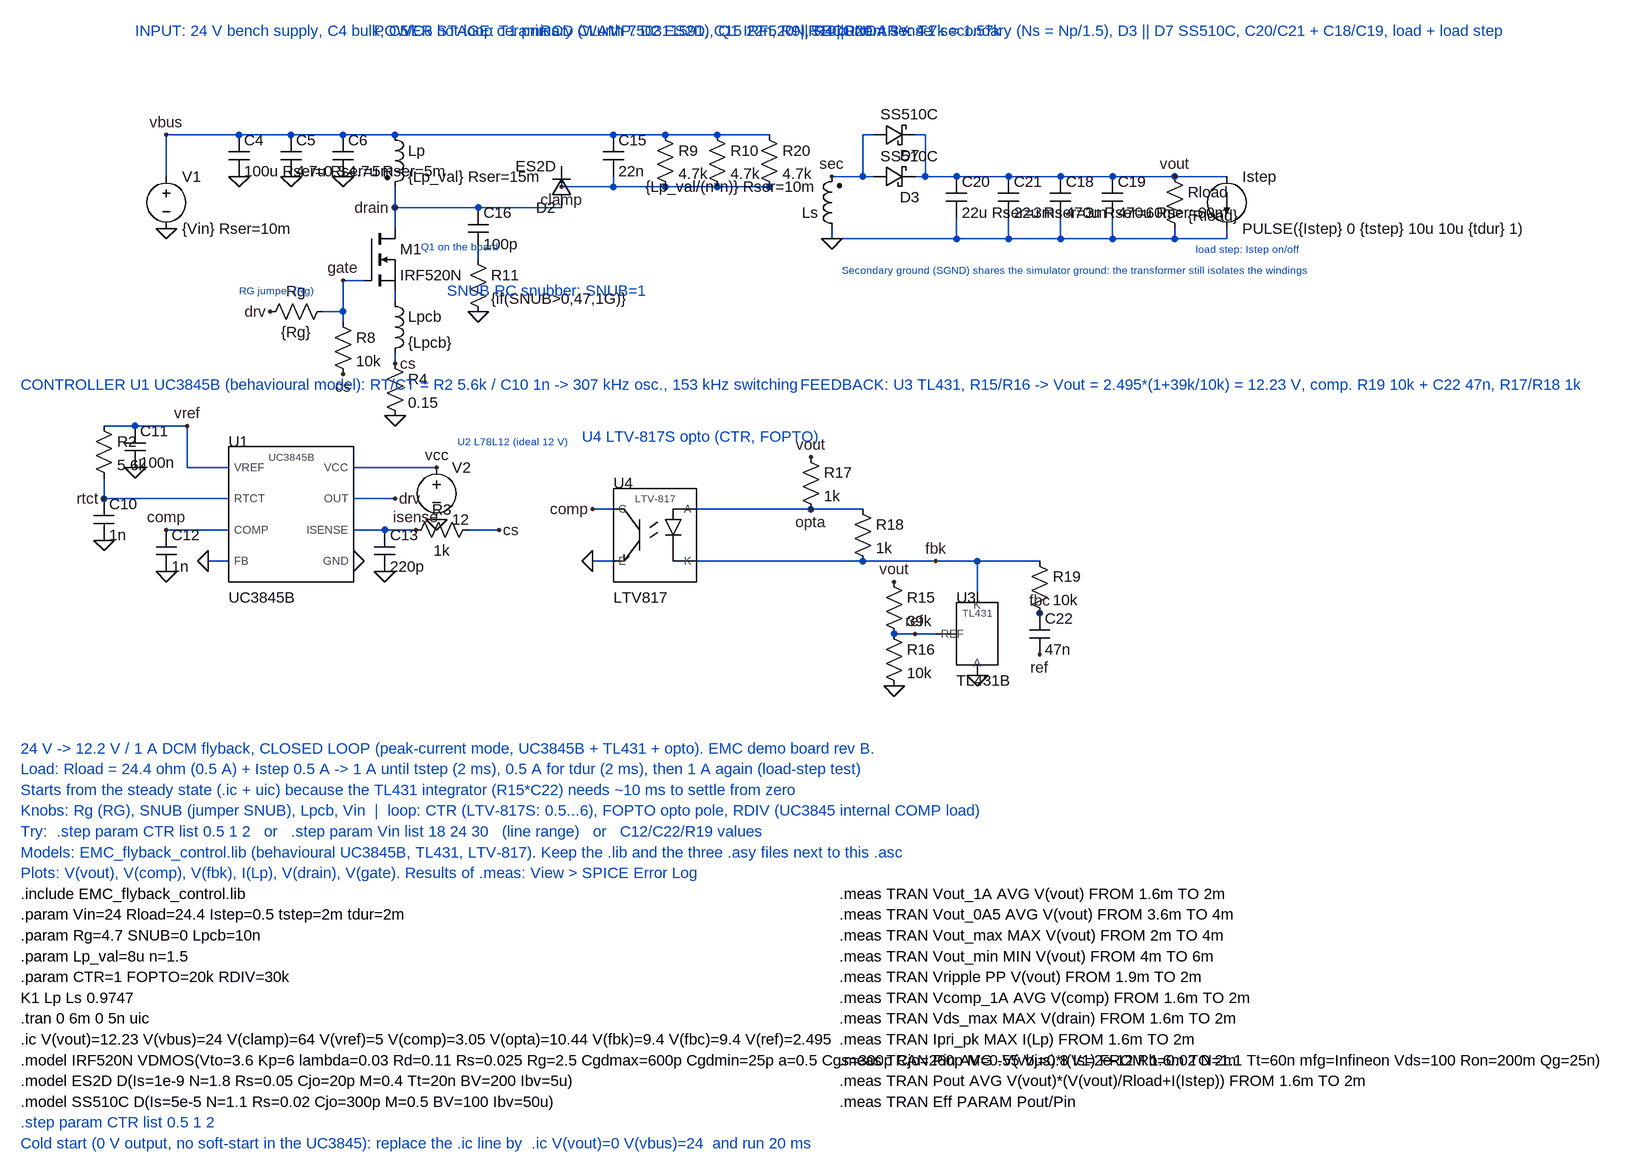
[diagram p0: schematic EMC_flyback_closed_loop.asc]
EMC_flyback_closed_loop.asc, the LTspice schematic file:
Version 4
SHEET 1 2000 1500
WIRE 64 192 64 128
WIRE 64 128 176 128
WIRE 176 128 256 128
WIRE 256 128 336 128
WIRE 336 128 416 128
WIRE 416 128 752 128
WIRE 752 128 832 128
WIRE 832 128 912 128
WIRE 912 128 992 128
WIRE 416 208 416 240
WIRE 416 240 416 272
WIRE 416 368 416 384
WIRE 416 464 416 480
WIRE 304 400 336 400
WIRE 336 400 336 352
WIRE 336 352 368 352
WIRE 336 400 336 416
WIRE 416 240 544 240
WIRE 544 304 544 320
WIRE 544 240 672 240
WIRE 672 176 672 208
WIRE 672 208 752 208
WIRE 752 208 832 208
WIRE 832 208 912 208
WIRE 912 208 992 208
WIRE 752 192 752 208
WIRE 832 208 832 208
WIRE 912 208 912 208
WIRE 992 208 992 208
WIRE 1088 192 1136 192
WIRE 1136 192 1152 192
WIRE 1216 192 1232 192
WIRE 1232 192 1280 192
WIRE 1280 192 1360 192
WIRE 1360 192 1440 192
WIRE 1440 192 1520 192
WIRE 1520 192 1616 192
WIRE 1616 192 1696 192
WIRE 1136 192 1136 128
WIRE 1136 128 1152 128
WIRE 1216 128 1232 128
WIRE 1232 128 1232 192
WIRE 1280 256 1280 288
WIRE 1360 256 1360 288
WIRE 1440 256 1440 288
WIRE 1520 256 1520 288
WIRE 1616 272 1616 288
WIRE 1088 272 1088 288
WIRE 1088 288 1280 288
WIRE 1280 288 1360 288
WIRE 1360 288 1440 288
WIRE 1440 288 1520 288
WIRE 1520 288 1616 288
WIRE 1616 288 1696 288
WIRE 1696 272 1696 288
WIRE 160 640 96 640
WIRE 96 640 96 576
WIRE 96 576 16 576
WIRE 16 576 -32 576
WIRE -32 656 -32 688
WIRE 160 688 -32 688
WIRE 160 736 64 736
WIRE 160 784 128 784
WIRE 352 688 416 688
WIRE 352 640 480 640
WIRE 352 736 400 736
WIRE 400 736 448 736
WIRE 528 736 576 736
WIRE 752 704 720 704
WIRE 752 784 720 784
WIRE 880 704 1056 704
WIRE 1056 704 1136 704
WIRE 880 784 1136 784
WIRE 1136 784 1248 784
WIRE 1248 784 1312 784
WIRE 1312 784 1408 784
WIRE 1312 784 1312 832
WIRE 1184 896 1216 896
WIRE 1216 896 1248 896
WIRE 1408 864 1408 864
FLAG 64 272 0
FLAG 176 192 0
FLAG 256 192 0
FLAG 336 192 0
FLAG 64 128 vbus
FLAG 416 240 drain
FLAG 416 560 0
FLAG 416 480 cs
FLAG 224 400 drv
FLAG 336 496 cs
FLAG 336 352 gate
FLAG 544 400 0
FLAG 672 208 clamp
FLAG 1088 192 sec
FLAG 1616 192 vout
FLAG 1088 288 0
FLAG 16 640 0
FLAG -32 752 0
FLAG 96 576 vref
FLAG -32 688 rtct
FLAG 64 800 0
FLAG 64 736 comp
FLAG 128 784 0
FLAG 416 688 drv
FLAG 480 720 0
FLAG 480 640 vcc
FLAG 352 784 0
FLAG 576 736 cs
FLAG 400 800 0
FLAG 448 736 isense
FLAG 720 704 comp
FLAG 720 784 0
FLAG 1056 624 vout
FLAG 1056 704 opta
FLAG 1248 784 fbk
FLAG 1312 960 0
FLAG 1184 816 vout
FLAG 1184 976 0
FLAG 1216 896 ref
FLAG 1408 928 ref
FLAG 1408 864 fbc
SYMBOL voltage 64 176 R0
SYMATTR InstName V1
SYMATTR Value {Vin} Rser=10m
SYMBOL cap 160 128 R0
SYMATTR InstName C4
SYMATTR Value 100u Rser=0.3
SYMBOL cap 240 128 R0
SYMATTR InstName C5
SYMATTR Value 4.7u Rser=5m
SYMBOL cap 320 128 R0
SYMATTR InstName C6
SYMATTR Value 4.7u Rser=5m
SYMBOL ind2 400 112 R0
SYMATTR InstName Lp
SYMATTR Value {Lp_val} Rser=15m
SYMBOL nmos 368 272 R0
SYMATTR InstName M1
SYMATTR Value IRF520N
SYMBOL ind 400 368 R0
SYMATTR InstName Lpcb
SYMATTR Value {Lpcb}
SYMBOL res 400 464 R0
SYMATTR InstName R4
SYMATTR Value 0.15
SYMBOL res 320 384 R90
WINDOW 0 0 56 VBottom 2
WINDOW 3 32 56 VTop 2
SYMATTR InstName Rg
SYMATTR Value {Rg}
SYMBOL res 320 400 R0
SYMATTR InstName R8
SYMATTR Value 10k
SYMBOL cap 528 240 R0
SYMATTR InstName C16
SYMATTR Value 100p
SYMBOL res 528 304 R0
SYMATTR InstName R11
SYMATTR Value {if(SNUB>0,47,1G)}
SYMBOL diode 688 240 R180
SYMATTR InstName D2
SYMATTR Value ES2D
SYMBOL cap 736 128 R0
SYMATTR InstName C15
SYMATTR Value 22n
SYMBOL res 816 112 R0
SYMATTR InstName R9
SYMATTR Value 4.7k
SYMBOL res 896 112 R0
SYMATTR InstName R10
SYMATTR Value 4.7k
SYMBOL res 976 112 R0
SYMATTR InstName R20
SYMATTR Value 4.7k
SYMBOL ind2 1104 288 R180
SYMATTR InstName Ls
SYMATTR Value {Lp_val/(n*n)} Rser=10m
SYMBOL schottky 1152 208 R270
WINDOW 0 0 56 VBottom 2
WINDOW 3 32 56 VTop 2
SYMATTR InstName D3
SYMATTR Value SS510C
SYMBOL schottky 1152 144 R270
WINDOW 0 0 56 VBottom 2
WINDOW 3 32 56 VTop 2
SYMATTR InstName D7
SYMATTR Value SS510C
SYMBOL cap 1264 192 R0
SYMATTR InstName C20
SYMATTR Value 22u Rser=3m
SYMBOL cap 1344 192 R0
SYMATTR InstName C21
SYMATTR Value 22u Rser=3m
SYMBOL cap 1424 192 R0
SYMATTR InstName C18
SYMATTR Value 470u Rser=60m
SYMBOL cap 1504 192 R0
SYMATTR InstName C19
SYMATTR Value 470u Rser=60m
SYMBOL res 1600 176 R0
SYMATTR InstName Rload
SYMATTR Value {Rload}
SYMBOL current 1696 192 R0
SYMATTR InstName Istep
SYMATTR Value PULSE({Istep} 0 {tstep} 10u 10u {tdur} 1)
SYMBOL UC3845B_beh 256 704 R0
SYMATTR InstName U1
SYMATTR Value UC3845B
SYMBOL cap 0 576 R0
SYMATTR InstName C11
SYMATTR Value 100n
SYMBOL res -48 560 R0
SYMATTR InstName R2
SYMATTR Value 5.6k
SYMBOL cap -48 688 R0
SYMATTR InstName C10
SYMATTR Value 1n
SYMBOL cap 48 736 R0
SYMATTR InstName C12
SYMATTR Value 1n
SYMBOL voltage 480 624 R0
SYMATTR InstName V2
SYMATTR Value 12
SYMBOL res 544 720 R90
WINDOW 0 0 56 VBottom 2
WINDOW 3 32 56 VTop 2
SYMATTR InstName R3
SYMATTR Value 1k
SYMBOL cap 384 736 R0
SYMATTR InstName C13
SYMATTR Value 220p
SYMBOL LTV817_beh 816 736 R0
SYMATTR InstName U4
SYMATTR Value LTV817
SYMBOL res 1040 608 R0
SYMATTR InstName R17
SYMATTR Value 1k
SYMBOL res 1120 688 R0
SYMATTR InstName R18
SYMATTR Value 1k
SYMBOL TL431_beh 1312 896 R0
SYMATTR InstName U3
SYMATTR Value TL431B
SYMBOL res 1168 800 R0
SYMATTR InstName R15
SYMATTR Value 39k
SYMBOL res 1168 880 R0
SYMATTR InstName R16
SYMATTR Value 10k
SYMBOL res 1392 768 R0
SYMATTR InstName R19
SYMATTR Value 10k
SYMBOL cap 1392 864 R0
SYMATTR InstName C22
SYMATTR Value 47n
TEXT 16 -32 Left 2 ;INPUT: 24 V bench supply, C4 bulk, C5/C6 hot-loop ceramics
TEXT 384 -32 Left 2 ;POWER STAGE: T1 primary (Wurth 750311591), Q1 IRF520N, R4 current sense
TEXT 456 300 Left 1 ;Q1 on the board
TEXT 176 368 Left 1 ;RG jumper (Rg)
TEXT 496 368 Left 2 ;SNUB RC snubber: SNUB=1
TEXT 640 -32 Left 2 ;RCD CLAMP: D2 ES2D, C15 22n, R9||R10||R20 = 3 x 4.7k = 1.57k
TEXT 1056 -32 Left 2 ;SECONDARY: T1 secondary (Ns = Np/1.5), D3 || D7 SS510C, C20/C21 + C18/C19, load + load step
TEXT 1104 336 Left 1 ;Secondary ground (SGND) shares the simulator ground: the transformer still isolates the windings
TEXT 1648 304 Left 1 ;load step: Istep on/off
TEXT -160 512 Left 2 ;CONTROLLER U1 UC3845B (behavioural model): RT/CT = R2 5.6k / C10 1n -> 307 kHz osc., 153 kHz switching
TEXT 512 600 Left 1 ;U2 L78L12 (ideal 12 V)
TEXT 704 592 Left 2 ;U4 LTV-817S opto (CTR, FOPTO)
TEXT 1040 512 Left 2 ;FEEDBACK: U3 TL431, R15/R16 -> Vout = 2.495*(1+39k/10k) = 12.23 V, comp. R19 10k + C22 47n, R17/R18 1k
TEXT -160 1072 Left 2 ;24 V -> 12.2 V / 1 A DCM flyback, CLOSED LOOP (peak-current mode, UC3845B + TL431 + opto). EMC demo board rev B.
TEXT -160 1104 Left 2 ;Load: Rload = 24.4 ohm (0.5 A) + Istep 0.5 A -> 1 A until tstep (2 ms), 0.5 A for tdur (2 ms), then 1 A again (load-step test)
TEXT -160 1136 Left 2 ;Starts from the steady state (.ic + uic) because the TL431 integrator (R15*C22) needs ~10 ms to settle from zero
TEXT -160 1168 Left 2 ;Knobs: Rg (RG), SNUB (jumper SNUB), Lpcb, Vin  |  loop: CTR (LTV-817S: 0.5...6), FOPTO opto pole, RDIV (UC3845 internal COMP load)
TEXT -160 1200 Left 2 ;Try:  .step param CTR list 0.5 1 2   or   .step param Vin list 18 24 30   (line range)   or   C12/C22/R19 values
TEXT -160 1232 Left 2 ;Models: EMC_flyback_control.lib (behavioural UC3845B, TL431, LTV-817). Keep the .lib and the three .asy files next to this .asc
TEXT -160 1264 Left 2 ;Plots: V(vout), V(comp), V(fbk), I(Lp), V(drain), V(gate). Results of .meas: View > SPICE Error Log
TEXT -160 1296 Left 2 !.include EMC_flyback_control.lib
TEXT -160 1328 Left 2 !.param Vin=24 Rload=24.4 Istep=0.5 tstep=2m tdur=2m
TEXT -160 1360 Left 2 !.param Rg=4.7 SNUB=0 Lpcb=10n
TEXT -160 1392 Left 2 !.param Lp_val=8u n=1.5
TEXT -160 1424 Left 2 !.param CTR=1 FOPTO=20k RDIV=30k
TEXT -160 1456 Left 2 !K1 Lp Ls 0.9747
TEXT -160 1488 Left 2 !.tran 0 6m 0 5n uic
TEXT -160 1520 Left 2 !.ic V(vout)=12.23 V(vbus)=24 V(clamp)=64 V(vref)=5 V(comp)=3.05 V(opta)=10.44 V(fbk)=9.4 V(fbc)=9.4 V(ref)=2.495
TEXT -160 1552 Left 2 !.model IRF520N VDMOS(Vto=3.6 Kp=6 lambda=0.03 Rd=0.11 Rs=0.025 Rg=2.5 Cgdmax=600p Cgdmin=25p a=0.5 Cgs=300p Cjo=260p M=0.55 Vj=0.8 Is=2e-12 Rb=0.02 N=1.1 Tt=60n mfg=Infineon Vds=100 Ron=200m Qg=25n)
TEXT -160 1584 Left 2 !.model ES2D D(Is=1e-9 N=1.8 Rs=0.05 Cjo=20p M=0.4 Tt=20n BV=200 Ibv=5u)
TEXT -160 1616 Left 2 !.model SS510C D(Is=5e-5 N=1.1 Rs=0.02 Cjo=300p M=0.5 BV=100 Ibv=50u)
TEXT -160 1648 Left 2 ;.step param CTR list 0.5 1 2
TEXT -160 1680 Left 2 ;Cold start (0 V output, no soft-start in the UC3845): replace the .ic line by  .ic V(vout)=0 V(vbus)=24  and run 20 ms
TEXT 1100 1296 Left 2 !.meas TRAN Vout_1A AVG V(vout) FROM 1.6m TO 2m
TEXT 1100 1328 Left 2 !.meas TRAN Vout_0A5 AVG V(vout) FROM 3.6m TO 4m
TEXT 1100 1360 Left 2 !.meas TRAN Vout_max MAX V(vout) FROM 2m TO 4m
TEXT 1100 1392 Left 2 !.meas TRAN Vout_min MIN V(vout) FROM 4m TO 6m
TEXT 1100 1424 Left 2 !.meas TRAN Vripple PP V(vout) FROM 1.9m TO 2m
TEXT 1100 1456 Left 2 !.meas TRAN Vcomp_1A AVG V(comp) FROM 1.6m TO 2m
TEXT 1100 1488 Left 2 !.meas TRAN Vds_max MAX V(drain) FROM 1.6m TO 2m
TEXT 1100 1520 Left 2 !.meas TRAN Ipri_pk MAX I(Lp) FROM 1.6m TO 2m
TEXT 1100 1552 Left 2 !.meas TRAN Pin AVG -V(vbus)*I(V1) FROM 1.6m TO 2m
TEXT 1100 1584 Left 2 !.meas TRAN Pout AVG V(vout)*(V(vout)/Rload+I(Istep)) FROM 1.6m TO 2m
TEXT 1100 1616 Left 2 !.meas TRAN Eff PARAM Pout/Pin

The netlist it stands for:
* EMC_flyback_closed_loop.asc
V1 vbus 0 {Vin} Rser=10m
C4 vbus 0 100u Rser=0.3
C5 vbus 0 4.7u Rser=5m
C6 vbus 0 4.7u Rser=5m
Lp vbus drain {Lp_val} Rser=15m
M1 drain gate N001 N001 IRF520N
Lpcb N001 cs {Lpcb}
R4 cs 0 0.15
Rg gate drv {Rg}
R8 gate cs 10k
C16 drain N002 100p
R11 N002 0 {if(SNUB>0,47,1G)}
D2 drain clamp ES2D
C15 vbus clamp 22n
R9 vbus clamp 4.7k
R10 vbus clamp 4.7k
R20 vbus clamp 4.7k
Ls 0 sec {Lp_val/(n*n)} Rser=10m
D3 sec vout SS510C
D7 sec vout SS510C
C20 vout 0 22u Rser=3m
C21 vout 0 22u Rser=3m
C18 vout 0 470u Rser=60m
C19 vout 0 470u Rser=60m
Rload vout 0 {Rload}
Istep vout 0 PULSE({Istep} 0 {tstep} 10u 10u {tdur} 1)
XU1 comp 0 isense rtct 0 drv vcc vref UC3845B  ; pins COMP FB ISENSE RTCT GND OUT VCC VREF
C11 vref 0 100n
R2 vref rtct 5.6k
C10 rtct 0 1n
C12 comp 0 1n
V2 vcc 0 12
R3 cs isense 1k
C13 isense 0 220p
XU4 opta fbk comp 0 LTV817  ; pins A K C E
R17 vout opta 1k
R18 opta fbk 1k
XU3 fbk 0 ref TL431B  ; pins K A REF
R15 vout ref 39k
R16 ref 0 10k
R19 fbk fbc 10k
C22 fbc ref 47n
.model D D
.lib standard.dio
.model NMOS NMOS
.model PMOS PMOS
.lib standard.mos
* INPUT: 24 V bench supply, C4 bulk, C5/C6 hot-loop ceramics
* POWER STAGE: T1 primary (Wurth 750311591), Q1 IRF520N, R4 current sense
* Q1 on the board
* RG jumper (Rg)
* SNUB RC snubber: SNUB=1
* RCD CLAMP: D2 ES2D, C15 22n, R9||R10||R20 = 3 x 4.7k = 1.57k
* SECONDARY: T1 secondary (Ns = Np/1.5), D3 || D7 SS510C, C20/C21 + C18/C19, load + load step
* Secondary ground (SGND) shares the simulator ground: the transformer still isolates the windings
* load step: Istep on/off
* CONTROLLER U1 UC3845B (behavioural model): RT/CT = R2 5.6k / C10 1n -> 307 kHz osc., 153 kHz switching
* U2 L78L12 (ideal 12 V)
* U4 LTV-817S opto (CTR, FOPTO)
* FEEDBACK: U3 TL431, R15/R16 -> Vout = 2.495*(1+39k/10k) = 12.23 V, comp. R19 10k + C22 47n, R17/R18 1k
* 24 V -> 12.2 V / 1 A DCM flyback, CLOSED LOOP (peak-current mode, UC3845B + TL431 + opto). EMC demo board rev B.
* Load: Rload = 24.4 ohm (0.5 A) + Istep 0.5 A -> 1 A until tstep (2 ms), 0.5 A for tdur (2 ms), then 1 A again (load-step test)
* Starts from the steady state (.ic + uic) because the TL431 integrator (R15*C22) needs ~10 ms to settle from zero
* Knobs: Rg (RG), SNUB (jumper SNUB), Lpcb, Vin  |  loop: CTR (LTV-817S: 0.5...6), FOPTO opto pole, RDIV (UC3845 internal COMP load)
* Try:  .step param CTR list 0.5 1 2   or   .step param Vin list 18 24 30   (line range)   or   C12/C22/R19 values
* Models: EMC_flyback_control.lib (behavioural UC3845B, TL431, LTV-817). Keep the .lib and the three .asy files next to this .asc
* Plots: V(vout), V(comp), V(fbk), I(Lp), V(drain), V(gate). Results of .meas: View > SPICE Error Log
.include EMC_flyback_control.lib
.param Vin=24 Rload=24.4 Istep=0.5 tstep=2m tdur=2m
.param Rg=4.7 SNUB=0 Lpcb=10n
.param Lp_val=8u n=1.5
.param CTR=1 FOPTO=20k RDIV=30k
K1 Lp Ls 0.9747
.tran 0 6m 0 5n uic
.ic V(vout)=12.23 V(vbus)=24 V(clamp)=64 V(vref)=5 V(comp)=3.05 V(opta)=10.44 V(fbk)=9.4 V(fbc)=9.4 V(ref)=2.495
.model IRF520N VDMOS(Vto=3.6 Kp=6 lambda=0.03 Rd=0.11 Rs=0.025 Rg=2.5 Cgdmax=600p Cgdmin=25p a=0.5 Cgs=300p Cjo=260p M=0.55 Vj=0.8 Is=2e-12 Rb=0.02 N=1.1 Tt=60n mfg=Infineon Vds=100 Ron=200m Qg=25n)
.model ES2D D(Is=1e-9 N=1.8 Rs=0.05 Cjo=20p M=0.4 Tt=20n BV=200 Ibv=5u)
.model SS510C D(Is=5e-5 N=1.1 Rs=0.02 Cjo=300p M=0.5 BV=100 Ibv=50u)
* .step param CTR list 0.5 1 2
* Cold start (0 V output, no soft-start in the UC3845): replace the .ic line by  .ic V(vout)=0 V(vbus)=24  and run 20 ms
.meas TRAN Vout_1A AVG V(vout) FROM 1.6m TO 2m
.meas TRAN Vout_0A5 AVG V(vout) FROM 3.6m TO 4m
.meas TRAN Vout_max MAX V(vout) FROM 2m TO 4m
.meas TRAN Vout_min MIN V(vout) FROM 4m TO 6m
.meas TRAN Vripple PP V(vout) FROM 1.9m TO 2m
.meas TRAN Vcomp_1A AVG V(comp) FROM 1.6m TO 2m
.meas TRAN Vds_max MAX V(drain) FROM 1.6m TO 2m
.meas TRAN Ipri_pk MAX I(Lp) FROM 1.6m TO 2m
.meas TRAN Pin AVG -V(vbus)*I(V1) FROM 1.6m TO 2m
.meas TRAN Pout AVG V(vout)*(V(vout)/Rload+I(Istep)) FROM 1.6m TO 2m
.meas TRAN Eff PARAM Pout/Pin
.backanno
.end